# Altium schematic sheet ACQ_FE_VREG.SchDoc
size 297 x 209 mm
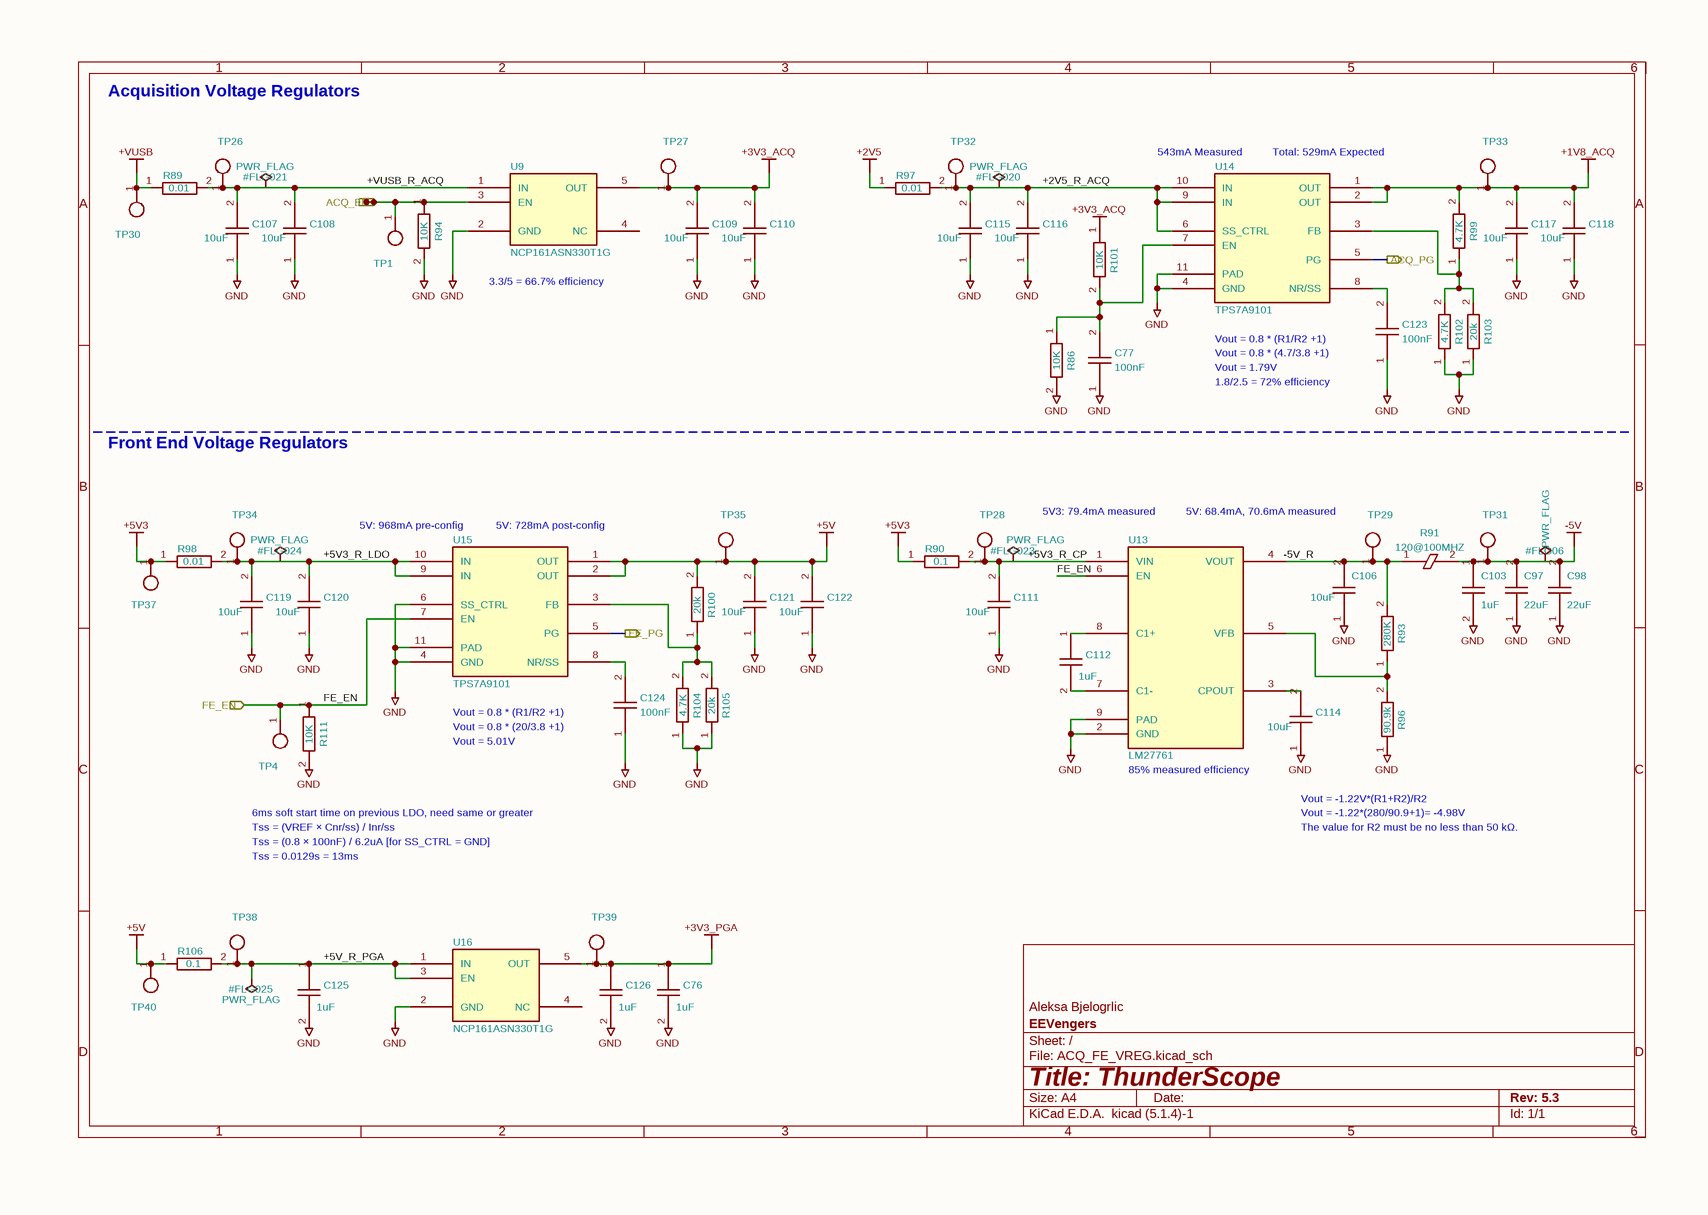
[diagram p0: ACQ_FE_VREG.SchDoc]

## Parts
#FLG06  PWR_FLAG  (graphical)
#FLG020  PWR_FLAG  (graphical)
#FLG021  PWR_FLAG  (graphical)
#FLG023  PWR_FLAG  (graphical)
#FLG024  PWR_FLAG  (graphical)
#FLG025  PWR_FLAG  (graphical)
C76  1uF  [GEN_C_0402]
C77  100nF  [GEN_C_0402]
C97  22uF  [GEN_C_0805]
C98  22uF  [GEN_C_0805]
C103  1uF  [GEN_C_0402]
C106  10uF  [GEN_C_0603]
C107  10uF  [GEN_C_0603]
C108  10uF  [GEN_C_0603]
C109  10uF  [GEN_C_0603]
C110  10uF  [GEN_C_0603]
C111  10uF  [GEN_C_0603]
C112  1uF  [GEN_C_0402]
C114  10uF  [GEN_C_0603]
C115  10uF  [GEN_C_0603]
C116  10uF  [GEN_C_0603]
C117  10uF  [GEN_C_0603]
C118  10uF  [GEN_C_0603]
C119  10uF  [GEN_C_0603]
C120  10uF  [GEN_C_0603]
C121  10uF  [GEN_C_0603]
C122  10uF  [GEN_C_0603]
C123  100nF  [GEN_C_0402]
C124  100nF  [GEN_C_0402]
C125  1uF  [GEN_C_0402]
C126  1uF  [GEN_C_0402]
R86  10K  [GEN_R_0402]
R89  0.01  [GEN_R_0603]
R90  0.1  [GEN_R_0402]
R91  120@100MHZ  [GEN_R_0402]
R93  280K  [GEN_R_0402]
R94  10K  [GEN_R_0402]
R96  90.9k  [GEN_R_0402]
R97  0.01  [GEN_R_0603]
R98  0.01  [GEN_R_0603]
R99  4.7K  [GEN_R_0402]
R100  20k  [GEN_R_0402]
R101  10K  [GEN_R_0402]
R102  4.7K  [GEN_R_0402]
R103  20k  [GEN_R_0402]
R104  4.7K  [GEN_R_0402]
R105  20k  [GEN_R_0402]
R106  0.1  [GEN_R_0402]
R111  10K  [GEN_R_0402]
TP1  PCB  [GEN_TP_PCB]  (value not drawn)
TP4  PCB  [GEN_TP_PCB]  (value not drawn)
TP26  PCB  [GEN_TP_PCB]  (value not drawn)
TP27  PCB  [GEN_TP_PCB]  (value not drawn)
TP28  PCB  [GEN_TP_PCB]  (value not drawn)
TP29  PCB  [GEN_TP_PCB]  (value not drawn)
TP30  PCB  [GEN_TP_PCB]  (value not drawn)
TP31  PCB  [GEN_TP_PCB]  (value not drawn)
TP32  PCB  [GEN_TP_PCB]  (value not drawn)
TP33  PCB  [GEN_TP_PCB]  (value not drawn)
TP34  PCB  [GEN_TP_PCB]  (value not drawn)
TP35  PCB  [GEN_TP_PCB]  (value not drawn)
TP37  PCB  [GEN_TP_PCB]  (value not drawn)
TP38  PCB  [GEN_TP_PCB]  (value not drawn)
TP39  PCB  [GEN_TP_PCB]  (value not drawn)
TP40  PCB  [GEN_TP_PCB]  (value not drawn)
U9  NCP161ASN330T1G  [GEN_SOT23_5_950_2900X1600X1450]
U13  LM27761  [TI_WSON8_DSG0008A]
U14  TPS7A9101  [TI_WSON10_DSK0010A]
U15  TPS7A9101  [TI_WSON10_DSK0010A]
U16  NCP161ASN330T1G  [GEN_SOT23_5_950_2900X1600X1450]

## Ports
ACQ_EN (in), ACQ_PG (out), FE_EN (in), FE_PG (out)

## Nets
+1V8_ACQ: C117.2 C118.2 R99.2 TP33.1 U14.1(OUT) U14.2(OUT)
+2V5: R97.1
+3V3_ACQ: C109.2 C110.2 R101.1 TP27.1 U9.5(OUT)
+3V3_PGA: C76.1 C126.1 TP39.1 U16.5(OUT)
+5V: C121.2 C122.2 R100.2 R106.1 TP35.1 TP40.1 U15.1(OUT) U15.2(OUT)
+5V3: R90.1 R98.1 TP37.1
+VUSB: R89.1 TP30.1
-5V: #FLG06.1 C97.2 C98.2 C103.1 R91.2 TP31.1
GND: C76.2 C77.1 C97.1 C98.1 C103.2 C106.1 C107.1 C108.1 C109.1 C110.1 C111.1 C114.1 C115.1 C116.1 C117.1 C118.1 C119.1 C120.1 C121.1 C122.1 C123.1 C124.1 C125.2 C126.2 R86.2 R94.2 R96.1 R102.1 R103.1 R104.1 R105.1 R111.2 U9.2(GND) U13.2(GND) U13.9(PAD) U14.4(GND) U14.11(PAD) U15.4(GND) U15.6(SS_CTRL) U15.11(PAD) U16.2(GND)
+2V5_R_ACQ: #FLG020.1 C115.2 C116.2 R97.2 TP32.1 U14.6(SS_CTRL) U14.9(IN) U14.10(IN)
+5V3_R_CP: #FLG023.1 C111.2 R90.2 TP28.1 U13.1(VIN)
+5V3_R_LDO: #FLG024.1 C119.2 C120.2 R98.2 TP34.1 U15.9(IN) U15.10(IN)
+5V_R_PGA: #FLG025.1 C125.1 R106.2 TP38.1 U16.1(IN) U16.3(EN)
+VUSB_R_ACQ: #FLG021.1 C107.2 C108.2 R89.2 TP26.1 U9.1(IN)
-5V_R: C106.2 R91.1 R93.2 TP29.1 U13.4(VOUT)
ACQ_EN: R94.1 TP1.1 U9.3(EN) ; port ACQ_EN
ACQ_PG: U14.5(PG) ; port ACQ_PG
FE_EN: R111.1 TP4.1 U13.6(EN) U15.7(EN) ; port FE_EN
FE_PG: U15.5(PG) ; port FE_PG
NetC77_2: C77.2 R86.1 R101.2 U14.7(EN)
NetC112_1: C112.1 U13.8(C1+)
NetC112_2: C112.2 U13.7(C1-)
NetC114_2: C114.2 U13.3(CPOUT)
NetC123_2: C123.2 U14.8(NR/SS)
NetC124_2: C124.2 U15.8(NR/SS)
NetR93_1: R93.1 R96.2 U13.5(VFB)
NetR99_1: R99.1 R102.2 R103.2 U14.3(FB)
NetR100_1: R100.1 R104.2 R105.2 U15.3(FB)

Not connected (* = marked no-connect by the designer): U9 4(NC); U16 4(NC)

## Notes on the sheet
- Acquisition Voltage Regulators
- (near U14) 543mA Measured
- (near U14) Total: 529mA Expected
- 3.3/5 = 66.7% efficiency
- Vout = 0.8 * (R1/R2 +1)
- Vout = 0.8 * (4.7/3.8 +1)
- 1.8/2.5 = 72% efficiency
- Vout = 1.79V
- Front End Voltage Regulators
- (near U15) 5V: 968mA pre-config
- (near U15) 5V: 728mA post-config
- 5V3: 79.4mA measured
- 5V: 68.4mA, 70.6mA measured
- Vout = 0.8 * (20/3.8 +1)
- Vout = 5.01V
- (near U13) 85% measured efficiency
- Tss = 0.0129s = 13ms
- Tss = (0.8 × 100nF) / 6.2uA [for SS_CTRL = GND]
- 6ms soft start time on previous LDO, need same or greater
- Tss = (VREF × Cnr/ss) / Inr/ss
- Vout = -1.22V*(R1+R2)/R2
- Vout = -1.22*(280/90.9+1)= -4.98V
- The value for R2 must be no less than 50 kΩ.
- 1
- 2
- 3
- 4
- 5
- 6
- A
- B
- C
- Aleksa Bjelogrlic
- D
- Title: ThunderScope
- File: ACQ_FE_VREG.kicad_sch
- Sheet: /
- EEVengers
- KiCad E.D.A.  kicad (5.1.4)-1
- Size: A4
- Date:
- Rev: 5.3
- Id: 1/1

## Library data of the parts
C76 C103 C112 C125 C126 = CAP 1uF 25V X5R 0402: MANUFACTURER: Murata; MANUFACTURER PART NUMBER: GRM155R61E105KA12D; VOLTAGE RATING: 25V; Substitutions Policy: Any Parametric Equivalent; PACKAGE: 0402; SUPPLIER 1: Mouser; SUPPLIER PART NUMBER 1: 81-GRM155R61E105KA2D; Footprint: Thunderscope_Rev5:GEN_C_0402; Value: 1uF
C77 C123 C124 = CAP 100nF 16V X7R 0402: HOUSE PART NUMBER: C-100nF-0402-002; MANUFACTURER: Murata; MANUFACTURER PART NUMBER: GCM155R71C104KA55D; VOLTAGE RATING: 16V; Substitutions Policy: Any Parametric Equivalent; PACKAGE: 0402; SUPPLIER 1: Mouser; SUPPLIER PART NUMBER 1: 81-GCM155R71C104KA5D; Footprint: Thunderscope_Rev5:GEN_C_0402; Value: 100nF
C97 C98 = CAP 22uF 25V X5R 0805: HOUSE PART NUMBER: C-22uF-0805-002; MANUFACTURER: Murata; MANUFACTURER PART NUMBER: GRM21BR61E226ME44L; VOLTAGE RATING: 25V; Substitutions Policy: Any Parametric Equivalent; PACKAGE: 0805; SUPPLIER 1: Mouser; SUPPLIER PART NUMBER 1: 81-GRM21BR61E226ME4L; Footprint: Thunderscope_Rev5:GEN_C_0805; Value: 22uF
C106-C111 C114-C122 = CAP 10uF 25V X5R 0603: MANUFACTURER: Murata; MANUFACTURER PART NUMBER: GRM188R61E106MA73D; VOLTAGE RATING: 25V; Substitutions Policy: Any Parametric Equivalent; PACKAGE: 0402; SUPPLIER 1: Mouser; SUPPLIER PART NUMBER 1: 81-GRM188R61E106MA3D; Footprint: Thunderscope_Rev5:GEN_C_0603; Value: 10uF
R86 R94 R101 R111 = RES 10K OHM 1% 1/16W 0402: MANUFACTURER: Yageo; MANUFACTURER PART NUMBER: RC0402FR-0710KL; TOLERANCE: 1%; Substitutions Policy: Any Parametric Equivalent; PACKAGE: 0402; SUPPLIER 1: Mouser; SUPPLIER PART NUMBER 1: 603-RC0402FR-0710KL; Footprint: Thunderscope_Rev5:GEN_R_0402; Value: 10K
R89 R97 R98 = RES 0.01 OHM 1% 1/4W 0603: HOUSE PART NUMBER: R-0.01-0603-1%-001; MANUFACTURER: Susumu; MANUFACTURER PART NUMBER: RL0816T-R010-F; TOLERANCE: 1%; Substitutions Policy: Any Parametric Equivalent; SUPPLIER 1: Mouser; SUPPLIER PART NUMBER 1: 754-RL0816T-R010-F; PACKAGE: 0603; Footprint: Thunderscope_Rev5:GEN_R_0603; Value: 0.01
R90 R106 = RES 0.1 OHM 1% 1/6W 0402: MANUFACTURER: Panasonic; MANUFACTURER PART NUMBER: ERJ-2BSFR10X; TOLERANCE: 1%; Substitutions Policy: Any Parametric Equivalent; PACKAGE: 0402; SUPPLIER 1: Mouser; SUPPLIER PART NUMBER 1: 667-ERJ-2BSFR10X; Footprint: Thunderscope_Rev5:GEN_R_0402; Value: 0.1
R91 = FERRITE BEAD 120 OHM 0402: HOUSE PART NUMBER: BLM15PX121SN1D; MANUFACTURER: Murata; Substitutions Policy: No Substitutions; SUPPLIER 1: Mouser; SUPPLIER PART NUMBER 1: 81-BLM15PX121SN1D; MANUFACTURER PART NUMBER: BLM15PX121SN1D; PACKAGE: 0402; Footprint: Thunderscope_Rev5:GEN_R_0402; Value: 120@100MHZ
R93 = RES 280K OHM 1% 1/16W 0402: MANUFACTURER: Yageo; MANUFACTURER PART NUMBER: RC0402FR-07280KL; TOLERANCE: 1%; Substitutions Policy: Any Parametric Equivalent; PACKAGE: 0402; SUPPLIER 1: Mouser; SUPPLIER PART NUMBER 1: 603-RC0402FR-07280KL; Footprint: Thunderscope_Rev5:GEN_R_0402; Value: 280K
R96 = RES 90.9K OHM 1% 1/16W 0402: MANUFACTURER: Yageo; MANUFACTURER PART NUMBER: RC0402FR-0790K9L; TOLERANCE: 1%; Substitutions Policy: Any Parametric Equivalent; PACKAGE: 0402; SUPPLIER 1: Mouser; SUPPLIER PART NUMBER 1: 603-RC0402FR-0790K9L; Footprint: Thunderscope_Rev5:GEN_R_0402; Value: 90.9k
R99 R102 R104 = RES 4.7K OHM 1% 1/16W 0402: MANUFACTURER: Yageo; MANUFACTURER PART NUMBER: RC0402FR-074K7L; TOLERANCE: 1%; Substitutions Policy: Any Parametric Equivalent; PACKAGE: 0402; SUPPLIER 1: Mouser; SUPPLIER PART NUMBER 1: 603-RC0402FR-074K7L; Footprint: Thunderscope_Rev5:GEN_R_0402; Value: 4.7K
R100 R103 R105 = RES 20K OHM 1% 1/16W 0402: MANUFACTURER: Yageo; MANUFACTURER PART NUMBER: RC0402FR-0720KL; TOLERANCE: 1%; Substitutions Policy: Any Parametric Equivalent; PACKAGE: 0402; SUPPLIER 1: Mouser; SUPPLIER PART NUMBER 1: 603-RC0402FR-0720KL; Footprint: Thunderscope_Rev5:GEN_R_0402; Value: 20k
TP1 TP4 TP26-TP35 TP37-TP40 = TP PCB 1mm: Footprint: Thunderscope_Rev5:GEN_TP_PCB; Value: PCB
U9 U16 = IC LDO NCP161ASN330T1G: MANUFACTURER: onsemi; Substitutions Policy: No Substitutions; MANUFACTURER PART NUMBER: NCP161ASN330T1G; SUPPLIER 1: Mouser; SUPPLIER PART NUMBER 1: 863-NCP161ASN330T1G; PACKAGE: SOT-23-5; Value: NCP161ASN330T1G; Footprint: Thunderscope_Rev5:GEN_SOT23_5_950_2900X1600X1450
U13 = IC CPUMP LM27761: MANUFACTURER: Texas Instruments; MANUFACTURER PART NUMBER: LM27761DSGR; Substitutions Policy: No Substitutions; SUPPLIER 1: Texas Instruments; SUPPLIER PART NUMBER 1: LM27761DSGR; PACKAGE: 8-WFDFN (2x2mm); Value: LM27761; Footprint: Thunderscope_Rev5:TI_WSON8_DSG0008A
U14 U15 = IC LDO TPS7A9101: MANUFACTURER: Texas Instruments; MANUFACTURER PART NUMBER: TPS7A9101DSKR; Substitutions Policy: No Substitutions; SUPPLIER 1: Texas Instruments; SUPPLIER PART NUMBER 1: TPS7A9101DSKR; PACKAGE: 10-DFN (2.5x2.5mm); Value: TPS7A9101; Footprint: Thunderscope_Rev5:TI_WSON10_DSK0010A
#FLG06 #FLG020 #FLG021 #FLG023 #FLG024 #FLG025 = PWR_FLAG: Value: PWR_FLAG